# Altium schematic sheet DoAn.SchDoc
size A; SheetNumber: 1; SheetTotal: 1
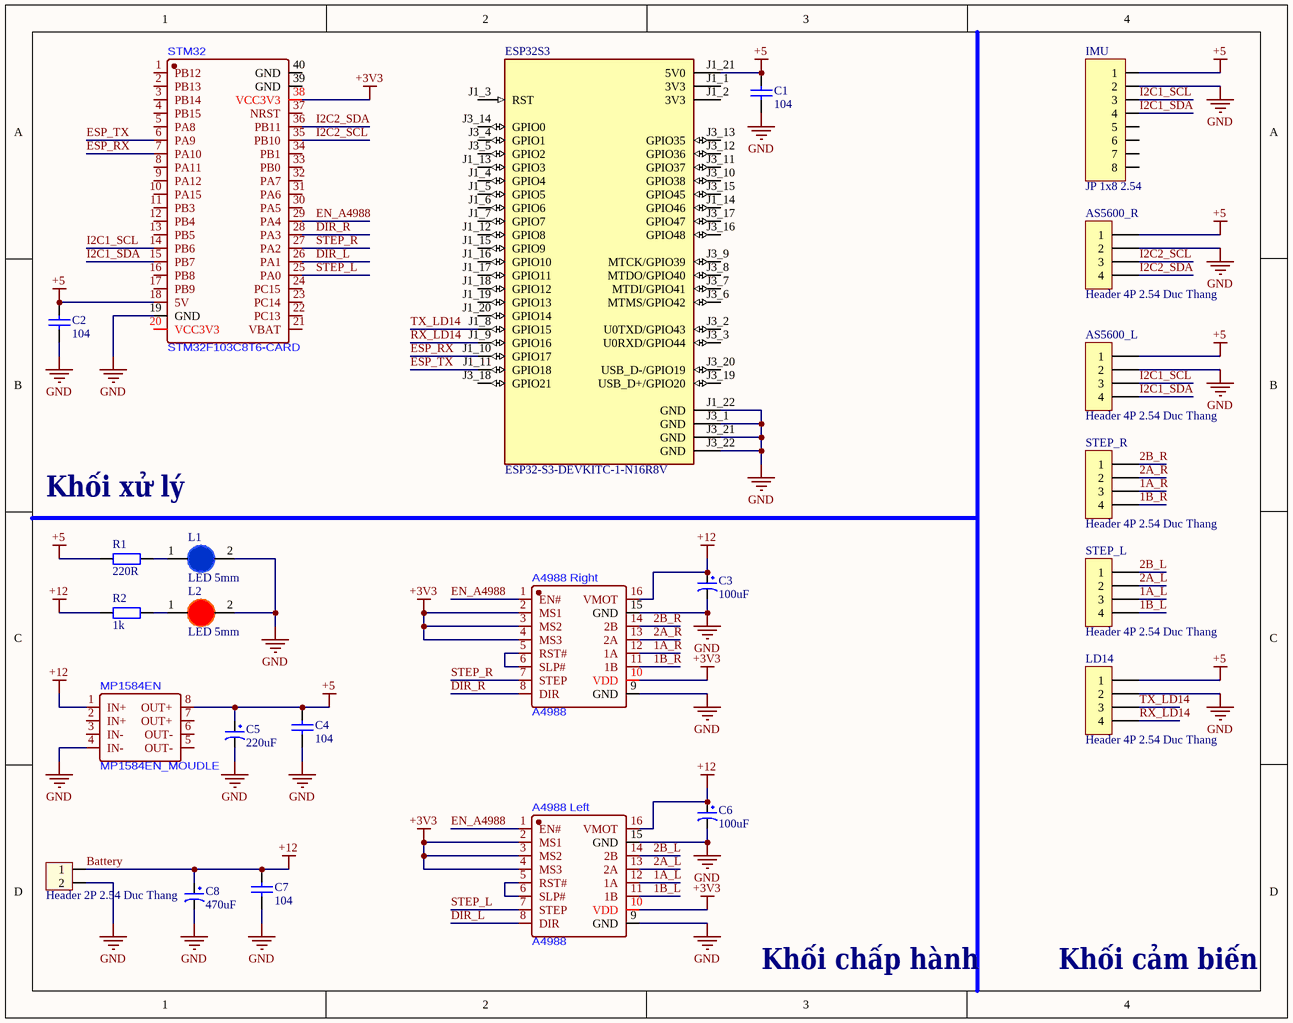
[diagram p0: DoAn.SchDoc]

## Parts
A4988_Left  A4988  [DIP-16_L20.3-W15.2-P2.54_LS12.7_A4988]
A4988_Right  A4988  [DIP-16_L20.3-W15.2-P2.54_LS12.7_A4988]
AS5600_L  Header 4P 2.54 Duc Thang  [XH2.54M-4]
AS5600_R  Header 4P 2.54 Duc Thang  [XH2.54M-4]
C1  104  [tu gom]
C2  104  [tu gom]
C3  100uF  [tu hoa 5mm]
C4  104  [tu gom]
C5  220uF  [Tu hoa 5mm]
C6  100uF  [tu hoa 5mm]
C7  104  [tu gom]
C8  470uF  [tu hoa 8mm]
ESP32S3  ESP32-S3-DEVKITC-1-N16R8V  [XCVR_ESP32-S3-DEVKITC-1-N16R8V]
H1  Header 2P 2.54 Duc Thang  [XH2.54M-2]
IMU  JP 1x8 2.54  [JP 1x8 CT]
L1  LED 5mm  [LED-5MM-BLUE]
L2  LED 5mm  [LED-5MM-RED]
LD14  Header 4P 2.54 Duc Thang  [XH2.54M-4]
MP1584EN  MP1584EN_MOUDLE  [PWRM-TH_MP1584EN_MOUDLE]
R1  220R  [tro vach 1/4w]
R2  1k  [tro vach 1/4w]
STEP_L  Header 4P 2.54 Duc Thang  [XH2.54M-4]
STEP_R  Header 4P 2.54 Duc Thang  [XH2.54M-4]
STM32  STM32F103C8T6-CARD  [CONN-TH_L53.3-W22.9_STM32F103C8T6-CARD]

## Nets
+3V3: A4988_Left.2(MS1) A4988_Left.3(MS2) A4988_Left.4(MS3) A4988_Left.10(VDD) A4988_Right.2(MS1) A4988_Right.3(MS2) A4988_Right.4(MS3) A4988_Right.10(VDD) STM32.38(VCC3V3)
+5: AS5600_L.1 AS5600_R.1 C1.1 C2.1 C4.1 C5.1 ESP32S3.J1_21(5V0) IMU.1 LD14.1 MP1584EN.8(OUT+) R1.1 STM32.18(5V)
Battery: A4988_Left.16(VMOT) A4988_Right.16(VMOT) C3.1 C6.1 C7.1 C8.1 H1.1 MP1584EN.1(IN+) R2.1  [also labelled +12]
GND: A4988_Left.9(GND) A4988_Left.15(GND) A4988_Right.9(GND) A4988_Right.15(GND) AS5600_L.2 AS5600_R.2 C1.2 C2.2 C3.2 C4.2 C5.2 C6.2 C7.2 C8.2 ESP32S3.J1_22(GND) ESP32S3.J3_1(GND) ESP32S3.J3_21(GND) ESP32S3.J3_22(GND) H1.2 IMU.2 L1.2(K) L2.2(K) LD14.2 MP1584EN.4(IN-) STM32.19(GND)
1A_L: A4988_Left.12(1A) STEP_L.3
1A_R: A4988_Right.12(1A) STEP_R.3
1B_L: A4988_Left.11(1B) STEP_L.4
1B_R: A4988_Right.11(1B) STEP_R.4
2A_L: A4988_Left.13(2A) STEP_L.2
2A_R: A4988_Right.13(2A) STEP_R.2
2B_L: A4988_Left.14(2B) STEP_L.1
2B_R: A4988_Right.14(2B) STEP_R.1
DIR_L: A4988_Left.8(DIR) STM32.26(PA1)
DIR_R: A4988_Right.8(DIR) STM32.28(PA3)
EN_A4988: A4988_Left.1(EN#) A4988_Right.1(EN#) STM32.29(PA4)
ESP_RX: ESP32S3.J1_10(GPIO17) STM32.7(PA10)
ESP_TX: ESP32S3.J1_11(GPIO18) STM32.6(PA9)
I2C1_SCL: AS5600_L.3 IMU.3 STM32.14(PB6)
I2C1_SDA: AS5600_L.4 IMU.4 STM32.15(PB7)
I2C2_SCL: AS5600_R.3 STM32.35(PB10)
I2C2_SDA: AS5600_R.4 STM32.36(PB11)
RX_LD14: ESP32S3.J1_9(GPIO16) LD14.4
STEP_L: A4988_Left.7(STEP) STM32.25(PA0)
STEP_R: A4988_Right.7(STEP) STM32.27(PA2)
TX_LD14: ESP32S3.J1_8(GPIO15) LD14.3
NetA4988_Left_5: A4988_Left.5(RST#) A4988_Left.6(SLP#)
NetA4988_Right_5: A4988_Right.5(RST#) A4988_Right.6(SLP#)
NetL1_1: L1.1(A) R1.2
NetL2_1: L2.1(A) R2.2

Not connected (* = marked no-connect by the designer): ESP32S3 J1_1(3V3) J1_2(3V3) J1_3(RST) J1_4(GPIO4) J1_5(GPIO5) J1_6(GPIO6) J1_7(GPIO7) J1_12(GPIO8) J1_13(GPIO3) J1_14(GPIO46) J1_15(GPIO9) J1_16(GPIO10) J1_17(GPIO11) J1_18(GPIO12) J1_19(GPIO13) J1_20(GPIO14) J3_2(U0TXD/GPIO43) J3_3(U0RXD/GPIO44) J3_4(GPIO1) J3_5(GPIO2) J3_6(MTMS/GPIO42) J3_7(MTDI/GPIO41) J3_8(MTDO/GPIO40) J3_9(MTCK/GPIO39) J3_10(GPIO38) J3_11(GPIO37) J3_12(GPIO36) J3_13(GPIO35) J3_14(GPIO0) J3_15(GPIO45) J3_16(GPIO48) J3_17(GPIO47) J3_18(GPIO21) J3_19(USB_D+/GPIO20) J3_20(USB_D-/GPIO19); IMU 5 6 7 8; MP1584EN 2(IN+) 3(IN-) 5(OUT-) 6(OUT-) 7(OUT+); STM32 1(PB12) 2(PB13) 3(PB14) 4(PB15) 5(PA8) 8(PA11) 9(PA12) 10(PA15) 11(PB3) 12(PB4) 13(PB5) 16(PB8) 17(PB9) 20(VCC3V3) 21(VBAT) 22(PC13) 23(PC14) 24(PC15) 30(PA5) 31(PA6) 32(PA7) 33(PB0) 34(PB1) 37(NRST) 39(GND) 40(GND)

## Notes on the sheet
- Khối xử lý
- Khối chấp hành
- Khối cảm biến

## Library data of the parts
AS5600_L AS5600_R LD14 STEP_L STEP_R = Header 4P 2.54 Duc Thang: Cắm; Ten_Linh_Kien: Header 4P XH2.54-4P Đực Thẳng; Don_Vi: Con; Ma_Hang: MH001285; Chung_Loai: Cắm
C1 C2 C4 C7 = Tu gom 104 50V: Cắm; So_Chan: 2; Ten_Linh_Kien: Tụ gốm 104 100nF 50V; Don_Vi: Con; Ma_Hang: MH004761; Chung_Loai: Cắm; Kieu_Chan: *
C3 C6 = Tu Hoa 100uF 25V 6x11: Cắm; Don_Vi: Con; So_Chan: 2; Ten_Linh_Kien: Tụ Hóa 100uF 25V 6x11MM; Ma_Hang: MH001351; Chung_Loai: Cắm; Kieu_Chan: *
C5 = Tu Hoa 220uF 16V 6x11: Cắm; Don_Vi: Con; So_Chan: 2; Ten_Linh_Kien: Tụ Hóa 220uF 16V 6x11MM; Ma_Hang: MH001348; Chung_Loai: Cắm; Kieu_Chan: *
C8 = Tu Hoa 470uF 25V 8x13: Cắm; Don_Vi: Con; So_Chan: 2; Ten_Linh_Kien: Tụ Hóa 470uF 25V; Ma_Hang: MH 470uF 25V; Chung_Loai: Cắm; Kieu_Chan: *
ESP32S3 = ESP32-S3-DEVKITC-1-N16R8V: Development Boards & Kits - Wireless Gen-Purpose Dev Board, embeds ESP32-S3-WROOM-2-N16R8V, 16 MB Octal Flash, 8 MB Octal PSRAM, with Pin Header; MF: Espressif Systems; SnapEDA_Link: https://www.snapeda.com/parts/ESP32-S3-DEVKITC-1-N16R8V/Espressif+Systems/view-part/?ref=snap; Package: None; Value: *; MP: ESP32-S3-DEVKITC-1-N16R8V; Check_prices: https://www.snapeda.com/parts/ESP32-S3-DEVKITC-1-N16R8V/Espressif+Systems/view-part/?ref=eda
H1 = Header 2P 2.54 Duc Thang: Cắm; Ten_Linh_Kien: Header 2P XH2.54-2P Đực Thẳng; Don_Vi: Con; Ma_Hang: MH001283; Chung_Loai: Cắm
IMU = JP 1x8 2.54 Cai Thang: Cắm; Ten_Linh_Kien: Jump Đơn Cái 2.54MM 1x20P Thẳng; Don_Vi: Con; Ma_Hang: MH004006; Ghi_Chu: *; Kieu_Chan: *; Chung_Loai: Cắm
L1 = LED 5mm Xanh Duong: Cắm; Don_Vi: Con; Ma_Hang: MH008987; Ten_Linh_Kien: Led 5MM Xanh Dương Đục (1000c); Ghi_Chu: *; Kieu_Chan: *; Chung_Loai: Cắm
L2 = LED 5mm Do: Cắm; Don_Vi: Con; Ma_Hang: MH008967; Ten_Linh_Kien: Led 5MM Phủ Đỏ (1000c); Ghi_Chu: *; Kieu_Chan: *; Chung_Loai: Cắm
R1 = Tro Vach 1/4W 5% 220R: Cắm; Don_Vi: Con; So_Chan: 2; Ten_Linh_Kien: Trở Vạch 1/4w 5% 220R; Ma_Hang: MH007300; Chung_Loai: Cắm; Kieu_Chan: *
R2 = Tro Vach 1/4W 5% 1k: Cắm; Don_Vi: Con; So_Chan: 2; Ten_Linh_Kien: Trở Vạch 1/4w 5% 1k; Ma_Hang: MH007390; Chung_Loai: Cắm; Kieu_Chan: *